# Altium project Digit_output_Ext.PrjPcb
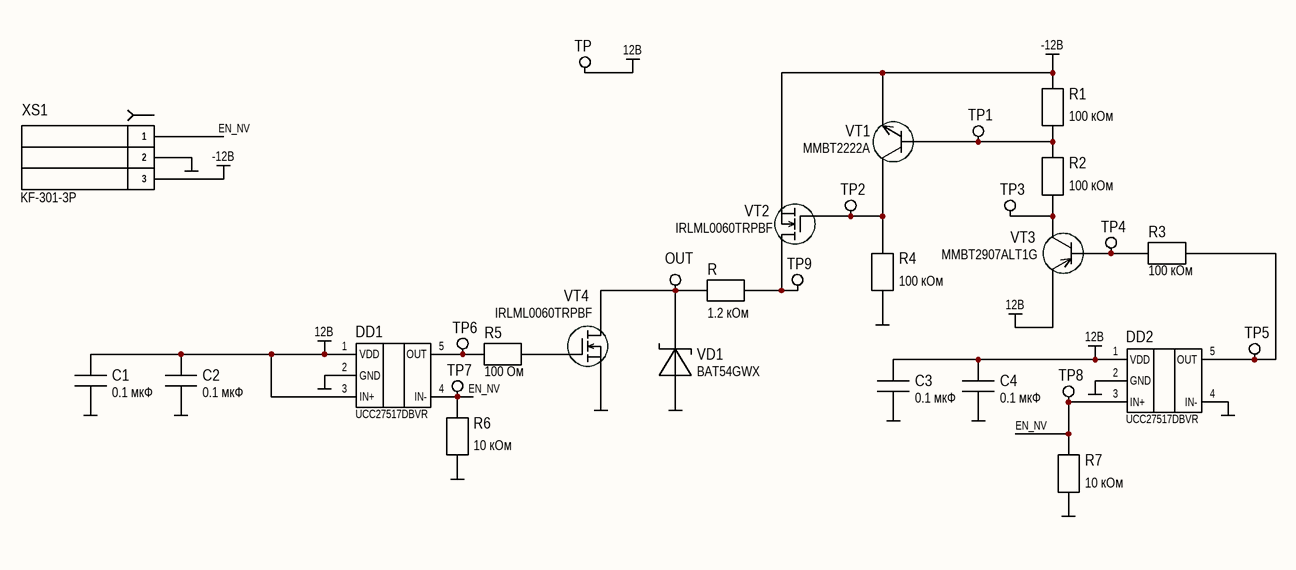
[diagram p0: Digit_output_Ext.SchDoc]
4 sheets, 31 parts. Net scope: global (net labels, ports and power ports of the same name join across sheets).
Board file: Digit_output_Ext.PcbDoc
Sheets:
  Digit_output_Ext.SchDoc
  Шаблон проекта Л2.SchDoc
  Шаблон проекта Л3.SchDoc
  Шаблон проекта Л4.SchDoc

## Sheet Digit_output_Ext.SchDoc
size 420 x 297 mm; Разраб.: Разраб.; Пров.: Пров.; Т.контр.: Т. контр.; Н.контр.: Н. контр; Утв.: Утв.; Лист: 1; Листов: 4; Децим.  №: ХXX.XXXXX.XXX.Э3; Название: Название; Лист.: 1; Листов.: 1

### Parts
C1  0.1 мкФ  [CAP 0603 3D]
C2  0.1 мкФ  [CAP 0603 3D]
C3  0.1 мкФ  [CAP 0603 3D]
C4  0.1 мкФ  [CAP 0603 3D]
DD1  UCC27517DBVR  [SOT-23-5]
DD2  UCC27517DBVR  [SOT-23-5]
OUT  TP  [Test_Point_2mm]  (value not drawn)
R  1.2 кОм  [Res_2512 3D]
R1  100 кОм  [Res_0603 3D]
R2  100 кОм  [Res_0603 3D]
R3  100 кОм  [Res_0603 3D]
R4  100 кОм  [Res_0603 3D]
R5  100 Ом  [Res_0603 3D]
R6  10 кОм  [Res_0603 3D]
R7  10 кОм  [Res_0603 3D]
TP  TP  [Test_Point_2mm]  (value not drawn)
TP1  TP  [Test_Point_1mm]  (value not drawn)
TP2  TP  [Test_Point_1mm]  (value not drawn)
TP3  TP  [Test_Point_1mm]  (value not drawn)
TP4  TP  [Test_Point_1mm]  (value not drawn)
TP5  TP  [Test_Point_1mm]  (value not drawn)
TP6  TP  [Test_Point_1mm]  (value not drawn)
TP7  TP  [Test_Point_1mm]  (value not drawn)
TP8  TP  [Test_Point_1mm]  (value not drawn)
TP9  TP  [Test_Point_1mm]  (value not drawn)
VD1  BAT54GWX  [SOD-123f]
VT1  MMBT2222A  [SOT-23-3]
VT2  IRLML0060TRPBF  [SOT-23-3]
VT3  MMBT2907ALT1G  [SOT-23-3]
VT4  IRLML0060TRPBF  [SOT-23-3]
XS1  KF-301-3P  [Degson_DG301-5.0-03P-1X]

### Nets
12В: C1.1 C2.1 C3.1 C4.1 DD1.1(VDD) DD1.3(IN+) DD2.1(VDD) TP.1 VT3.3(E)
-12В: R1.2 VT1.3(E) VT2.3(S) XS1.3
GND: C1.2 C2.2 C3.2 C4.2 DD1.2(GND) DD2.2(GND) DD2.4(IN-) R4.1 R6.1 R7.1 VD1.2(A) VT4.3(S) XS1.2
EN_NV: DD1.4(IN-) DD2.3(IN+) R6.2 R7.2 TP7.1 TP8.1 XS1.1
NetDD1_5: DD1.5(OUT) R5.1 TP6.1
NetDD2_5: DD2.5(OUT) R3.2 TP5.1
NetOUT_1: OUT.1 R.1 VD1.1(K) VT4.2(D)
NetR1_1: R1.1 R2.2 TP1.1 VT1.1(B)
NetR2_1: R2.1 TP3.1 VT3.2(C)
NetR3_1: R3.1 TP4.1 VT3.1(B)
NetR4_2: R4.2 TP2.1 VT1.2(C) VT2.1(G)
NetR5_2: R5.2 VT4.1(G)
NetR_2: R.2 TP9.1 VT2.2(D)

### Notes on the sheet
- Перв. примен.
- Справ. №
- Подп. и дата
- Инв. № дубл.
- Взам. инв. №
- Изм.
- Лист
- № докум
- Подпись
- Дата
- Лит.
- Масса
- Масштаб
- Разраб
- Пров
- Т.контр.
- Листов
- Инв.№ подл.
- Н.контр.
- Утв.

### Library data of the parts
C1-C4 = C: GRM188R71H104KA93D
DD1 DD2 = UCC27517
R = R: RC2512FR-071K2L
R1-R4 = R: RC0603FR-07100KL
R5 = R: RC0603FR-07100RL
R6 R7 = R: RC0603FR-0710KL
VD1 = Диод Шот. х1
VT1 = VT NPN
VT2 VT4 = VT MOSFET-N
VT3 = VT PNP

## Sheet Шаблон проекта Л2.SchDoc
size 420 x 297 mm; Разраб.: Разраб.; Лист: 2; Листов: 4; Децим.  №: XXX.XXXXX.XXX.Э3

### Notes on the sheet
- Перв. примен.
- Справ. №
- Подп. и дата
- Инв. № дубл.
- Взам. инв. №
- Инв.№ подл.
- Лист
- Изм.
- № докум
- Подпись
- Дата

## Sheet Шаблон проекта Л3.SchDoc
size 420 x 297 mm; Разраб.: Разраб.; Лист: 3; Листов: 4; Децим.  №: XXX.XXXXX.XXX.Э3

### Notes on the sheet
- Перв. примен.
- Справ. №
- Подп. и дата
- Инв. № дубл.
- Взам. инв. №
- Инв.№ подл.
- Лист
- Изм.
- № докум
- Подпись
- Дата

## Sheet Шаблон проекта Л4.SchDoc
size 420 x 297 mm; Разраб.: Бурыкин; Лист: 4; Листов: 4; Децим.  №: XXX.XXXXX.XXX.Э3

### Notes on the sheet
- Перв. примен.
- Справ. №
- Подп. и дата
- Инв. № дубл.
- Взам. инв. №
- Инв.№ подл.
- Лист
- Изм.
- № докум
- Подпись
- Дата